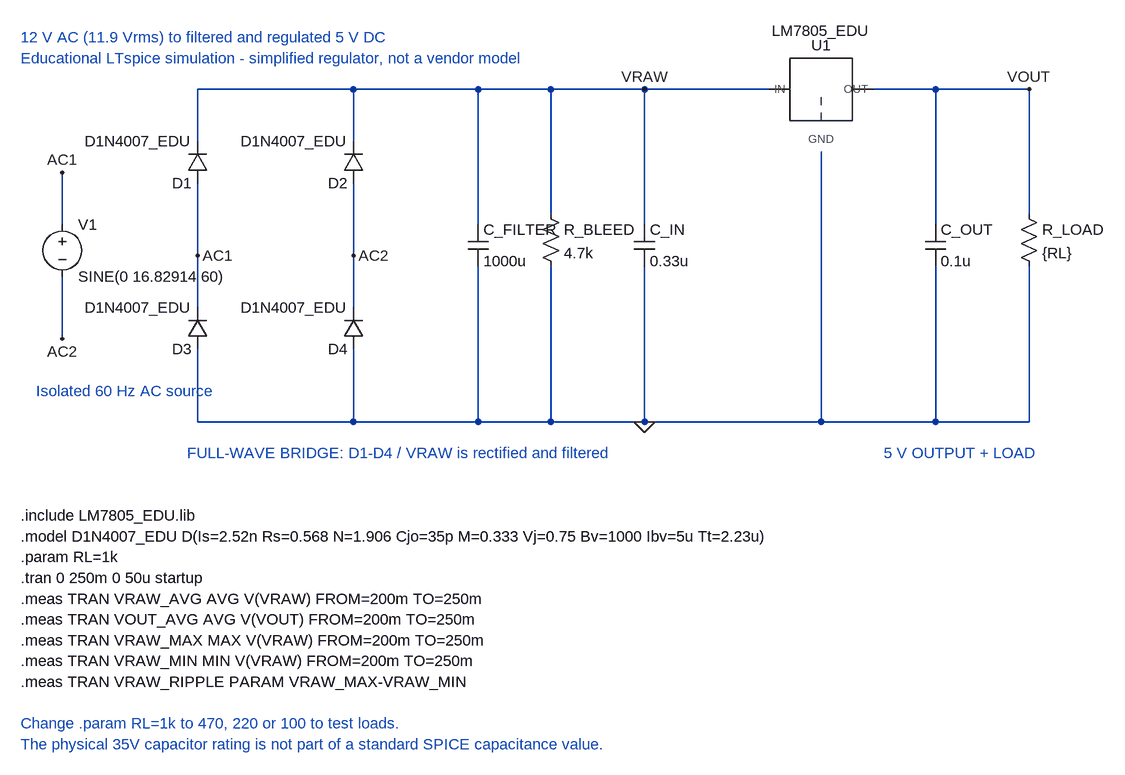
[diagram p0: schematic AC_DC_5V_Power_Supply.asc]
AC_DC_5V_Power_Supply.asc, the LTspice schematic file:
Version 4.1
SHEET 1 1792 1216
WIRE 112 224 112 304
WIRE 112 384 112 480
WIRE 320 96 320 176
WIRE 320 240 320 352
WIRE 320 352 320 432
WIRE 320 496 320 608
WIRE 560 96 560 176
WIRE 560 240 560 352
WIRE 560 352 560 432
WIRE 560 496 560 608
WIRE 320 96 560 96
WIRE 560 96 752 96
WIRE 752 96 864 96
WIRE 864 96 1008 96
WIRE 1008 96 1200 96
WIRE 320 608 560 608
WIRE 560 608 752 608
WIRE 752 608 864 608
WIRE 864 608 1008 608
WIRE 1008 608 1280 608
WIRE 1280 608 1456 608
WIRE 1456 608 1600 608
WIRE 752 96 752 304
WIRE 752 368 752 608
WIRE 864 96 864 288
WIRE 864 368 864 608
WIRE 1008 96 1008 304
WIRE 1008 368 1008 608
WIRE 1280 192 1280 608
WIRE 1360 96 1456 96
WIRE 1456 96 1600 96
WIRE 1456 96 1456 304
WIRE 1456 368 1456 608
WIRE 1600 96 1600 288
WIRE 1600 368 1600 608
FLAG 112 224 AC1
FLAG 112 480 AC2
FLAG 320 352 AC1
FLAG 560 352 AC2
FLAG 1008 96 VRAW
FLAG 1600 96 VOUT
FLAG 1008 608 0
SYMBOL voltage 112 288 R0
SYMATTR InstName V1
SYMATTR Value SINE(0 16.82914 60)
SYMBOL diode 336 240 R180
SYMATTR InstName D1
SYMATTR Value D1N4007_EDU
SYMBOL diode 576 240 R180
SYMATTR InstName D2
SYMATTR Value D1N4007_EDU
SYMBOL diode 336 496 R180
SYMATTR InstName D3
SYMATTR Value D1N4007_EDU
SYMBOL diode 576 496 R180
SYMATTR InstName D4
SYMATTR Value D1N4007_EDU
SYMBOL cap 736 304 R0
SYMATTR InstName C_FILTER
SYMATTR Value 1000u
SYMBOL res 848 272 R0
SYMATTR InstName R_BLEED
SYMATTR Value 4.7k
SYMBOL cap 992 304 R0
SYMATTR InstName C_IN
SYMATTR Value 0.33u
SYMBOL LM7805_EDU 1280 96 R0
SYMATTR InstName U1
SYMATTR Value LM7805_EDU
SYMBOL cap 1440 304 R0
SYMATTR InstName C_OUT
SYMATTR Value 0.1u
SYMBOL res 1584 272 R0
SYMATTR InstName R_LOAD
SYMATTR Value {RL}
TEXT 48 16 Left 2 ;12 V AC (11.9 Vrms) to filtered and regulated 5 V DC
TEXT 48 48 Left 2 ;Educational LTspice simulation - simplified regulator, not a vendor model
TEXT 72 560 Left 2 ;Isolated 60 Hz AC source
TEXT 304 656 Left 2 ;FULL-WAVE BRIDGE: D1-D4 / VRAW is rectified and filtered
TEXT 1376 656 Left 2 ;5 V OUTPUT + LOAD
TEXT 48 752 Left 2 !.include LM7805_EDU.lib
TEXT 48 784 Left 2 !.model D1N4007_EDU D(Is=2.52n Rs=0.568 N=1.906 Cjo=35p M=0.333 Vj=0.75 Bv=1000 Ibv=5u Tt=2.23u)
TEXT 48 816 Left 2 !.param RL=1k
TEXT 48 848 Left 2 !.tran 0 250m 0 50u startup
TEXT 48 880 Left 2 !.meas TRAN VRAW_AVG AVG V(VRAW) FROM=200m TO=250m
TEXT 48 912 Left 2 !.meas TRAN VOUT_AVG AVG V(VOUT) FROM=200m TO=250m
TEXT 48 944 Left 2 !.meas TRAN VRAW_MAX MAX V(VRAW) FROM=200m TO=250m
TEXT 48 976 Left 2 !.meas TRAN VRAW_MIN MIN V(VRAW) FROM=200m TO=250m
TEXT 48 1008 Left 2 !.meas TRAN VRAW_RIPPLE PARAM VRAW_MAX-VRAW_MIN
TEXT 48 1072 Left 2 ;Change .param RL=1k to 470, 220 or 100 to test loads.
TEXT 48 1104 Left 2 ;The physical 35V capacitor rating is not part of a standard SPICE capacitance value.

The netlist it stands for:
* AC_DC_5V_Power_Supply.asc
V1 AC1 AC2 SINE(0 16.82914 60)
D1 AC1 VRAW D1N4007_EDU
D2 AC2 VRAW D1N4007_EDU
D3 0 AC1 D1N4007_EDU
D4 0 AC2 D1N4007_EDU
C_FILTER VRAW 0 1000u
R_BLEED VRAW 0 4.7k
C_IN VRAW 0 0.33u
X§U1 VRAW 0 VOUT LM7805_EDU  ; pins IN GND OUT
C_OUT VOUT 0 0.1u
R_LOAD VOUT 0 {RL}
.model D D
.lib standard.dio
* 12 V AC (11.9 Vrms) to filtered and regulated 5 V DC
* Educational LTspice simulation - simplified regulator, not a vendor model
* Isolated 60 Hz AC source
* FULL-WAVE BRIDGE: D1-D4 / VRAW is rectified and filtered
* 5 V OUTPUT + LOAD
.include LM7805_EDU.lib
.model D1N4007_EDU D(Is=2.52n Rs=0.568 N=1.906 Cjo=35p M=0.333 Vj=0.75 Bv=1000 Ibv=5u Tt=2.23u)
.param RL=1k
.tran 0 250m 0 50u startup
.meas TRAN VRAW_AVG AVG V(VRAW) FROM=200m TO=250m
.meas TRAN VOUT_AVG AVG V(VOUT) FROM=200m TO=250m
.meas TRAN VRAW_MAX MAX V(VRAW) FROM=200m TO=250m
.meas TRAN VRAW_MIN MIN V(VRAW) FROM=200m TO=250m
.meas TRAN VRAW_RIPPLE PARAM VRAW_MAX-VRAW_MIN
* Change .param RL=1k to 470, 220 or 100 to test loads.
* The physical 35V capacitor rating is not part of a standard SPICE capacitance value.
.backanno
.end

* Results of the author's LTspice run, read from the files saved beside the schematic
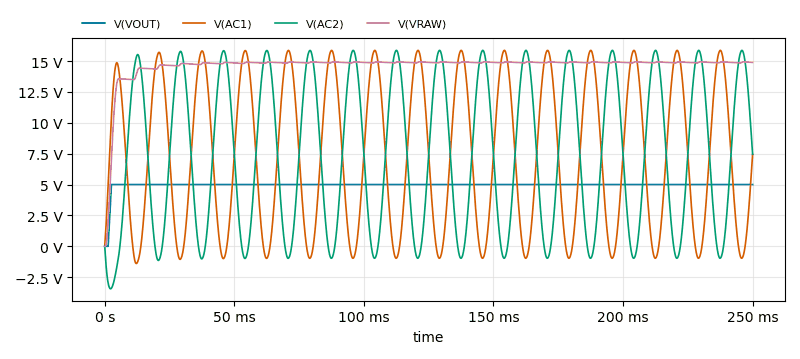
[diagram p1: Transient Analysis of AC_DC_5V_Power_Supply.asc, plotted from the saved traces]
* Transient Analysis, 1 run:
*   V(VOUT): min 0 V, max 5 V, average 4.961 V, rms 4.978 V, last 5 V
*   V(AC1): min -1.394 V, max 15.86 V, average 7.325 V, rms 9.424 V, last 7.445 V
*   V(AC2): min -3.442 V, max 15.86 V, average 7.325 V, rms 9.498 V, last 7.445 V
*   V(VRAW): min 0 V, max 14.94 V, average 14.65 V, rms 14.71 V, last 14.89 V
* From the log:
*   vraw_avg: AVG(V(VRAW))=14.8900988045 FROM 0.2 TO 0.25
*   vout_avg: AVG(V(VOUT))=4.99960000514 FROM 0.2 TO 0.25
*   vraw_max: MAX(V(VRAW))=14.9357843399 FROM 0.2 TO 0.25
*   vraw_min: MIN(V(VRAW))=14.844165802 FROM 0.2 TO 0.25
*   vraw_ripple: VRAW_MAX-VRAW_MIN=0.0916185379028